# Altium schematic sheet OLED.SchDoc
size A4; SheetNumber: 1; SheetTotal: 2
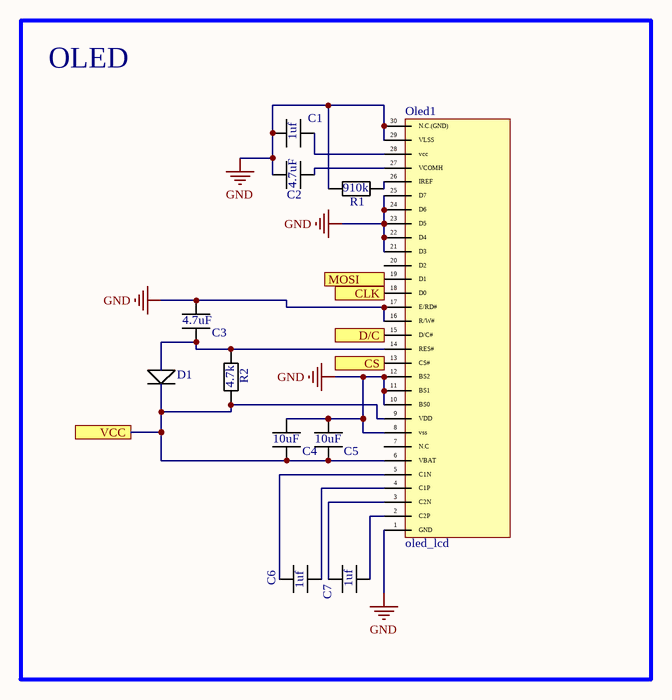
[diagram p0: OLED.SchDoc]

## Parts
C1  val: 1uf  [CAP_0402]  (hidden comment: CAP_0402)
C2  4.7uF  [CAP_0603]
C3  4.7uF  [CAP_0603]
C4  10uF  [CAP_0603]
C5  10uF  [CAP_0603]
C6  val: 1uf  [CAP_0402]  (hidden comment: CAP_0402)
C7  val: 1uf  [CAP_0402]  (hidden comment: CAP_0402)
D1  NSR05F40QNXT5G  [DIO_PMEG4005EPK]  (value not drawn)
Oled1  oled_lcd  [oled_lcd]
R1  val: 910k  [RES_0402]  (hidden comment: RES_0402)
R2  val: 4.7k  [RES_0402]  (hidden comment: RES_0402)

## Blocks framed on the sheet
OLED: C1-C7 D1 Oled1 R1 R2

## Ports
CLK (see RTC[2B]), CS (see RTC[2B]), D/C (see RTC[2B]), MOSI (see RTC[2B]), VCC (see RTC[2B])

## Nets
GND: C1.2 C2.2 C3.2 C4.2 C5.2 Oled1.1(GND) Oled1.8(vss) Oled1.10(BS0) Oled1.11(BS1) Oled1.12(BS2) Oled1.16(R/W#) Oled1.17(E/RD#) Oled1.21(D3) Oled1.22(D4) Oled1.23(D5) Oled1.24(D6) Oled1.25(D7) Oled1.29(VLSS) Oled1.30(N.C.(GND)) R1.1
CLK: Oled1.18(D0) ; port CLK
CS: Oled1.13(CS#) ; port CS
D/C: Oled1.15(D/C#) ; port D/C
MOSI: Oled1.19(D1) ; port MOSI
VCC: C4.1 C5.1 D1.2(-) Oled1.6(VBAT) Oled1.9(VDD) R2.1 ; port VCC
NetC1_1: C1.1 Oled1.28(vcc)
NetC2_1: C2.1 Oled1.27(VCOMH)
NetC3_1: C3.1 D1.1(+) Oled1.14(RES#) R2.2
NetC6_1: C6.1 Oled1.4(C1P)
NetC6_2: C6.2 Oled1.5(C1N)
NetC7_1: C7.1 Oled1.2(C2P)
NetC7_2: C7.2 Oled1.3(C2N)
NetOled1_26: Oled1.26(IREF) R1.2

Not connected (* = marked no-connect by the designer): Oled1 7(N.C) 20(D2)

## Library data of the parts
C1 C6 C7 = CAP_0402: Manufacturer: Taiyo Yuden; Manufacturer Part Number: UMK212B7104KG-T; PCN Part Number: X5R, X7R Dielectrics 23/Jan/2008; Catalog Drawings: xMK Series_0805_1.25; Capacitance: 0.1µF; Tolerance: ±10%; Voltage - Rated: 50V; Temperature Coefficient: X7R; Online Catalog: M Series; Other Names: 587-1279-6; Product Training Modules: Multilayer Ceramic Capacitors; Featured Product: Commodity Multilayer Ceramic Capacitors – CC Series; Standard Package: 1; Category: Capacitors; Family: Ceramic Capacitors; Series: M; Packaging: Digi-Reel®; Mounting Type: Surface Mount, MLCC; Operating Temperature: -55°C ~ 125°C; Applications: General Purpose; Ratings: -; Package / Case: 0805 (2012 Metric); Size / Dimension: 0.079" L x 0.049" W (2.00mm x 1.25mm); Height - Seated (Max): -; Thickness (Max): 0.053" (1.35mm); Lead Spacing: -; Features: -; Lead Style: -; ComponentLink1URL: https://datasheet.ciiva.com/30243/163umk212b7104kg-t-30243740.pdf; ComponentLink1Description: https://datasheet.ciiva.com/30243/163umk212b7104kg-t-30243740.pdf; ComponentLink2URL: https://datasheet.ciiva.com/133/umk212b7104kg-t-ss-133568.pdf; ComponentLink2Description: https://datasheet.ciiva.com/133/umk212b7104kg-t-ss-133568.pdf; ComponentLink3URL: https://datasheet.ciiva.com/28645/746258-28645307.pdf; ComponentLink3Description: https://datasheet.ciiva.com/28645/746258-28645307.pdf; ComponentLink4URL: https://datasheet.ciiva.com/7975/746258-7975900.pdf; ComponentLink4Description: https://datasheet.ciiva.com/7975/746258-7975900.pdf; ComponentLink5URL: https://datasheet.ciiva.com/11786/0900766b80d84f1d-11786009.pdf; ComponentLink5Description: https://datasheet.ciiva.com/11786/0900766b80d84f1d-11786009.pdf; ComponentLink6URL: https://datasheet.ciiva.com/16625/upy-gphc-x7r-6-3v-to-50v-8-16625549.pdf; ComponentLink6Description: https://datasheet.ciiva.com/16625/upy-gphc-x7r-6-3v-to-50v-8-16625549.pdf; ComponentLink7URL: https://datasheet.ciiva.com/155/mlccorderingcode-155931.pdf; ComponentLink7Description: https://datasheet.ciiva.com/155/mlccorderingcode-155931.pdf; ComponentLink8URL: https://datasheet.ciiva.com/46393/1734573-46393307.pdf; ComponentLink8Description: https://datasheet.ciiva.com/46393/1734573-46393307.pdf; ComponentLink9URL: https://datasheet.ciiva.com/155/mlccorderingcode-155930.pdf; ComponentLink9Description: https://datasheet.ciiva.com/155/mlccorderingcode-155930.pdf; ComponentLink10URL: https://datasheet.ciiva.com/28450/1489800-28450805.pdf; ComponentLink10Description: https://datasheet.ciiva.com/28450/1489800-28450805.pdf; ComponentLink11URL: https://datasheet.ciiva.com/11464/upy-gphc-x7r-6-3v-to-50v-8-11464757.pdf; ComponentLink11Description: https://datasheet.ciiva.com/11464/upy-gphc-x7r-6-3v-to-50v-8-11464757.pdf; ComponentLink12URL: https://datasheet.ciiva.com/155/mlccorderingcode-155929.pdf; ComponentLink12Description: https://datasheet.ciiva.com/155/mlccorderingcode-155929.pdf; ComponentLink13URL: https://datasheet.ciiva.com/29242/445210-da-01-en-kerko-chip-0805-x7r-0-1uf-10proz-50vg-29242074.pdf; ComponentLink13Description: https://datasheet.ciiva.com/29242/445210-da-01-en-kerko-chip-0805-x7r-0-1uf-10proz-50vg-29242074.pdf
C2-C5 = CAP_0603: note: any manufacturer
  C2 C3: val: 4.7uF
  C4 C5: val: 10uF